# Altium schematic sheet Top_Sheet.SchDoc
size B; DocumentNumber: 1; SheetNumber: 1; SheetTotal: 7
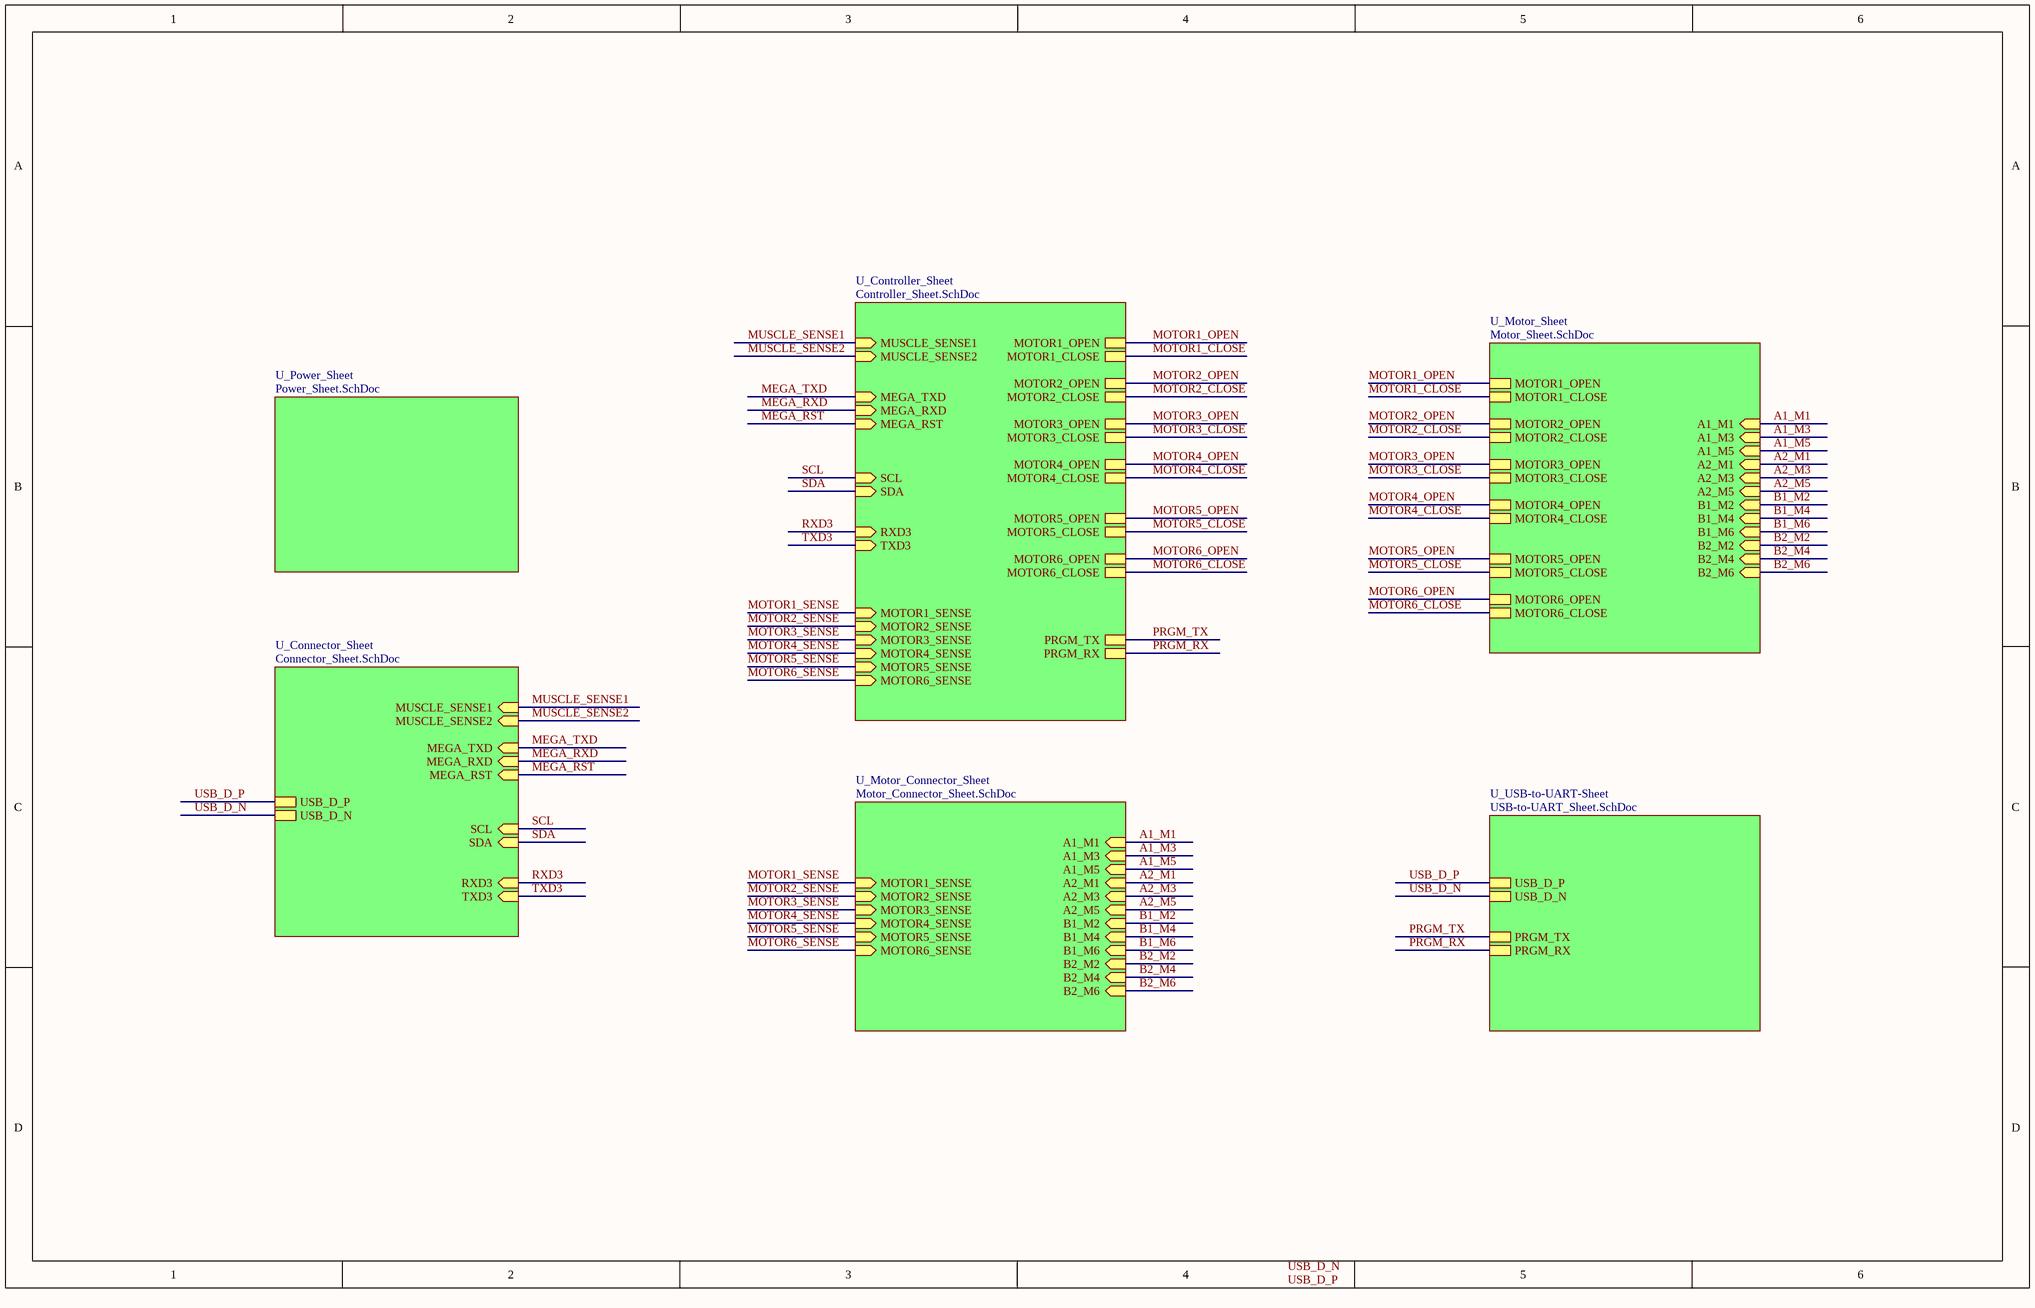
[diagram p0: Top_Sheet.SchDoc]

## Sub-sheets
U_Connector_Sheet = Connector_Sheet.SchDoc: MUSCLE_SENSE1 (in), SCL (in), SDA (in), MUSCLE_SENSE2 (in), RXD3 (in), TXD3 (in), MEGA_TXD (in), MEGA_RXD (in), MEGA_RST (in), USB_D_P, USB_D_N
U_Controller_Sheet = Controller_Sheet.SchDoc: MOTOR1_SENSE (in), MOTOR2_SENSE (in), MOTOR3_SENSE (in), MOTOR4_SENSE (in), MOTOR5_SENSE (in), MOTOR6_SENSE (in), MOTOR5_OPEN, MOTOR5_CLOSE, MOTOR6_OPEN, MOTOR6_CLOSE, MOTOR1_OPEN, MOTOR1_CLOSE, MOTOR2_OPEN, MOTOR2_CLOSE, MOTOR3_OPEN, MOTOR3_CLOSE, MOTOR4_OPEN, MOTOR4_CLOSE, SCL (in), SDA (in), RXD3 (in), TXD3 (in), MEGA_TXD (in), MEGA_RXD (in), MEGA_RST (in), MUSCLE_SENSE1 (in), MUSCLE_SENSE2 (in), PRGM_RX, PRGM_TX
U_Motor_Connector_Sheet = Motor_Connector_Sheet.SchDoc: MOTOR1_SENSE (in), MOTOR2_SENSE (in), MOTOR3_SENSE (in), MOTOR4_SENSE (in), MOTOR5_SENSE (in), MOTOR6_SENSE (in), B1_M6 (in), B2_M6 (in), A1_M5 (in), A2_M5 (in), B1_M4 (in), B2_M4 (in), A2_M3 (in), A1_M3 (in), B2_M2 (in), B1_M2 (in), A2_M1 (in), A1_M1 (in)
U_Motor_Sheet = Motor_Sheet.SchDoc: B2_M6 (in), B1_M6 (in), A2_M5 (in), A1_M5 (in), B2_M4 (in), B1_M4 (in), A2_M3 (in), A1_M3 (in), B2_M2 (in), B1_M2 (in), A2_M1 (in), A1_M1 (in), MOTOR6_CLOSE, MOTOR2_CLOSE, MOTOR2_OPEN, MOTOR4_OPEN, MOTOR5_CLOSE, MOTOR3_OPEN, MOTOR1_OPEN, MOTOR4_CLOSE, MOTOR3_CLOSE, MOTOR6_OPEN, MOTOR1_CLOSE, MOTOR5_OPEN
U_Power_Sheet = Power_Sheet.SchDoc: no entries
U_USB-to-UART-Sheet = USB-to-UART_Sheet.SchDoc: USB_D_P, USB_D_N, PRGM_RX, PRGM_TX

## Nets
A1_M1: sheet U_Motor_Connector_Sheet/A1_M1, sheet U_Motor_Sheet/A1_M1
A1_M3: sheet U_Motor_Connector_Sheet/A1_M3, sheet U_Motor_Sheet/A1_M3
A1_M5: sheet U_Motor_Connector_Sheet/A1_M5, sheet U_Motor_Sheet/A1_M5
A2_M1: sheet U_Motor_Connector_Sheet/A2_M1, sheet U_Motor_Sheet/A2_M1
A2_M3: sheet U_Motor_Connector_Sheet/A2_M3, sheet U_Motor_Sheet/A2_M3
A2_M5: sheet U_Motor_Connector_Sheet/A2_M5, sheet U_Motor_Sheet/A2_M5
B1_M2: sheet U_Motor_Connector_Sheet/B1_M2, sheet U_Motor_Sheet/B1_M2
B1_M4: sheet U_Motor_Connector_Sheet/B1_M4, sheet U_Motor_Sheet/B1_M4
B1_M6: sheet U_Motor_Connector_Sheet/B1_M6, sheet U_Motor_Sheet/B1_M6
B2_M2: sheet U_Motor_Connector_Sheet/B2_M2, sheet U_Motor_Sheet/B2_M2
B2_M4: sheet U_Motor_Connector_Sheet/B2_M4, sheet U_Motor_Sheet/B2_M4
B2_M6: sheet U_Motor_Connector_Sheet/B2_M6, sheet U_Motor_Sheet/B2_M6
MEGA_RST: sheet U_Connector_Sheet/MEGA_RST, sheet U_Controller_Sheet/MEGA_RST
MEGA_RXD: sheet U_Connector_Sheet/MEGA_RXD, sheet U_Controller_Sheet/MEGA_RXD
MEGA_TXD: sheet U_Connector_Sheet/MEGA_TXD, sheet U_Controller_Sheet/MEGA_TXD
MOTOR1_CLOSE: sheet U_Controller_Sheet/MOTOR1_CLOSE, sheet U_Motor_Sheet/MOTOR1_CLOSE
MOTOR1_OPEN: sheet U_Controller_Sheet/MOTOR1_OPEN, sheet U_Motor_Sheet/MOTOR1_OPEN
MOTOR1_SENSE: sheet U_Motor_Connector_Sheet/MOTOR1_SENSE, sheet U_Controller_Sheet/MOTOR1_SENSE
MOTOR2_CLOSE: sheet U_Controller_Sheet/MOTOR2_CLOSE, sheet U_Motor_Sheet/MOTOR2_CLOSE
MOTOR2_OPEN: sheet U_Controller_Sheet/MOTOR2_OPEN, sheet U_Motor_Sheet/MOTOR2_OPEN
MOTOR2_SENSE: sheet U_Motor_Connector_Sheet/MOTOR2_SENSE, sheet U_Controller_Sheet/MOTOR2_SENSE
MOTOR3_CLOSE: sheet U_Controller_Sheet/MOTOR3_CLOSE, sheet U_Motor_Sheet/MOTOR3_CLOSE
MOTOR3_OPEN: sheet U_Controller_Sheet/MOTOR3_OPEN, sheet U_Motor_Sheet/MOTOR3_OPEN
MOTOR3_SENSE: sheet U_Motor_Connector_Sheet/MOTOR3_SENSE, sheet U_Controller_Sheet/MOTOR3_SENSE
MOTOR4_CLOSE: sheet U_Controller_Sheet/MOTOR4_CLOSE, sheet U_Motor_Sheet/MOTOR4_CLOSE
MOTOR4_OPEN: sheet U_Controller_Sheet/MOTOR4_OPEN, sheet U_Motor_Sheet/MOTOR4_OPEN
MOTOR4_SENSE: sheet U_Motor_Connector_Sheet/MOTOR4_SENSE, sheet U_Controller_Sheet/MOTOR4_SENSE
MOTOR5_CLOSE: sheet U_Controller_Sheet/MOTOR5_CLOSE, sheet U_Motor_Sheet/MOTOR5_CLOSE
MOTOR5_OPEN: sheet U_Controller_Sheet/MOTOR5_OPEN, sheet U_Motor_Sheet/MOTOR5_OPEN
MOTOR5_SENSE: sheet U_Motor_Connector_Sheet/MOTOR5_SENSE, sheet U_Controller_Sheet/MOTOR5_SENSE
MOTOR6_CLOSE: sheet U_Controller_Sheet/MOTOR6_CLOSE, sheet U_Motor_Sheet/MOTOR6_CLOSE
MOTOR6_OPEN: sheet U_Controller_Sheet/MOTOR6_OPEN, sheet U_Motor_Sheet/MOTOR6_OPEN
MOTOR6_SENSE: sheet U_Motor_Connector_Sheet/MOTOR6_SENSE, sheet U_Controller_Sheet/MOTOR6_SENSE
MUSCLE_SENSE1: sheet U_Connector_Sheet/MUSCLE_SENSE1, sheet U_Controller_Sheet/MUSCLE_SENSE1
MUSCLE_SENSE2: sheet U_Connector_Sheet/MUSCLE_SENSE2, sheet U_Controller_Sheet/MUSCLE_SENSE2
PRGM_RX: sheet U_Controller_Sheet/PRGM_RX, sheet U_USB-to-UART-Sheet/PRGM_RX
PRGM_TX: sheet U_Controller_Sheet/PRGM_TX, sheet U_USB-to-UART-Sheet/PRGM_TX
RXD3: sheet U_Connector_Sheet/RXD3, sheet U_Controller_Sheet/RXD3
SCL: sheet U_Connector_Sheet/SCL, sheet U_Controller_Sheet/SCL
SDA: sheet U_Connector_Sheet/SDA, sheet U_Controller_Sheet/SDA
TXD3: sheet U_Connector_Sheet/TXD3, sheet U_Controller_Sheet/TXD3
USB_D_N: sheet U_Connector_Sheet/USB_D_N, sheet U_USB-to-UART-Sheet/USB_D_N
USB_D_P: sheet U_Connector_Sheet/USB_D_P, sheet U_USB-to-UART-Sheet/USB_D_P

## Notes on the sheet
- Labels drawn without touching a wire or pin: USB_D_N, USB_D_P